# EAGLE design mem3-b (EAGLE 9.7.0)
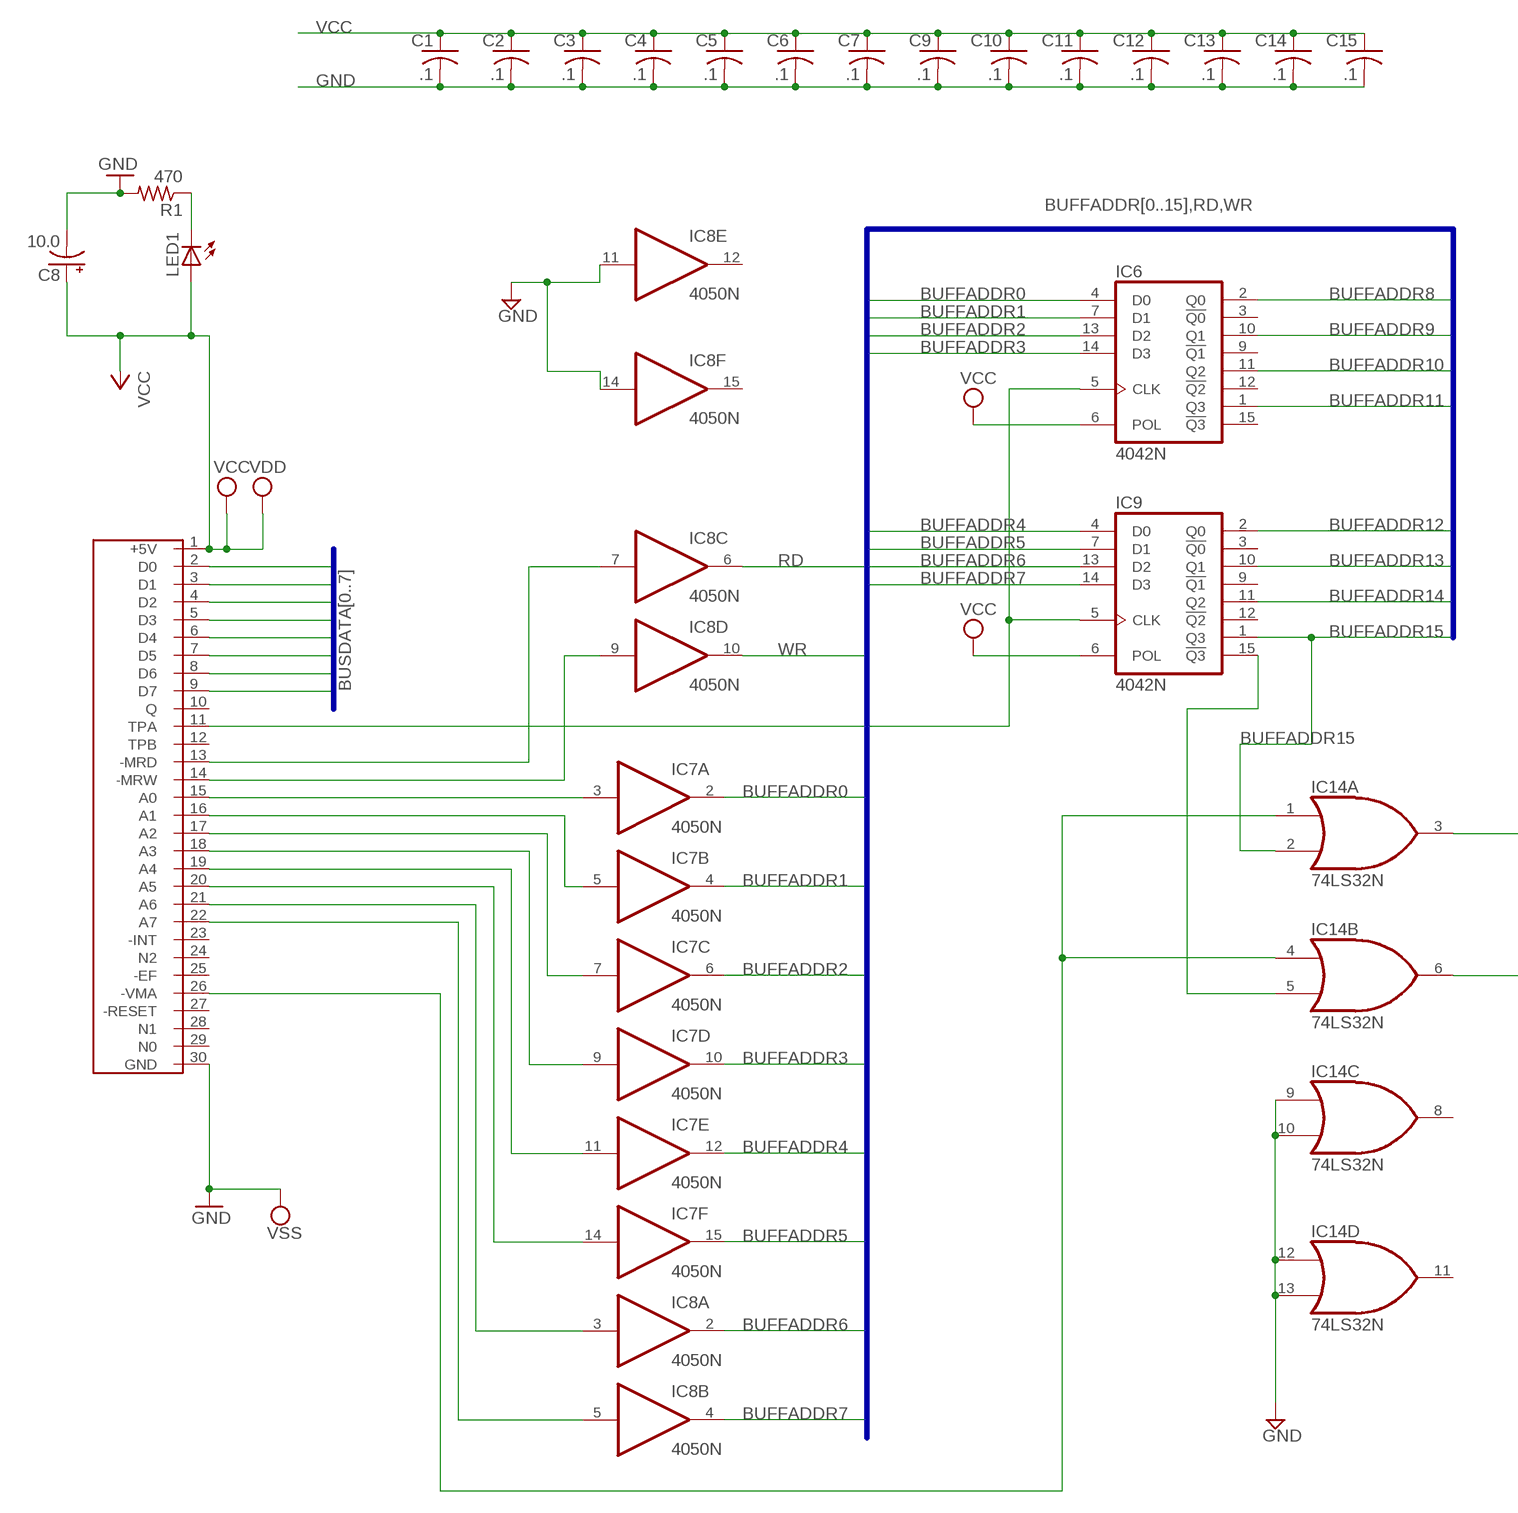
[diagram p0: schematic, sheet 1, part 1 of 2]
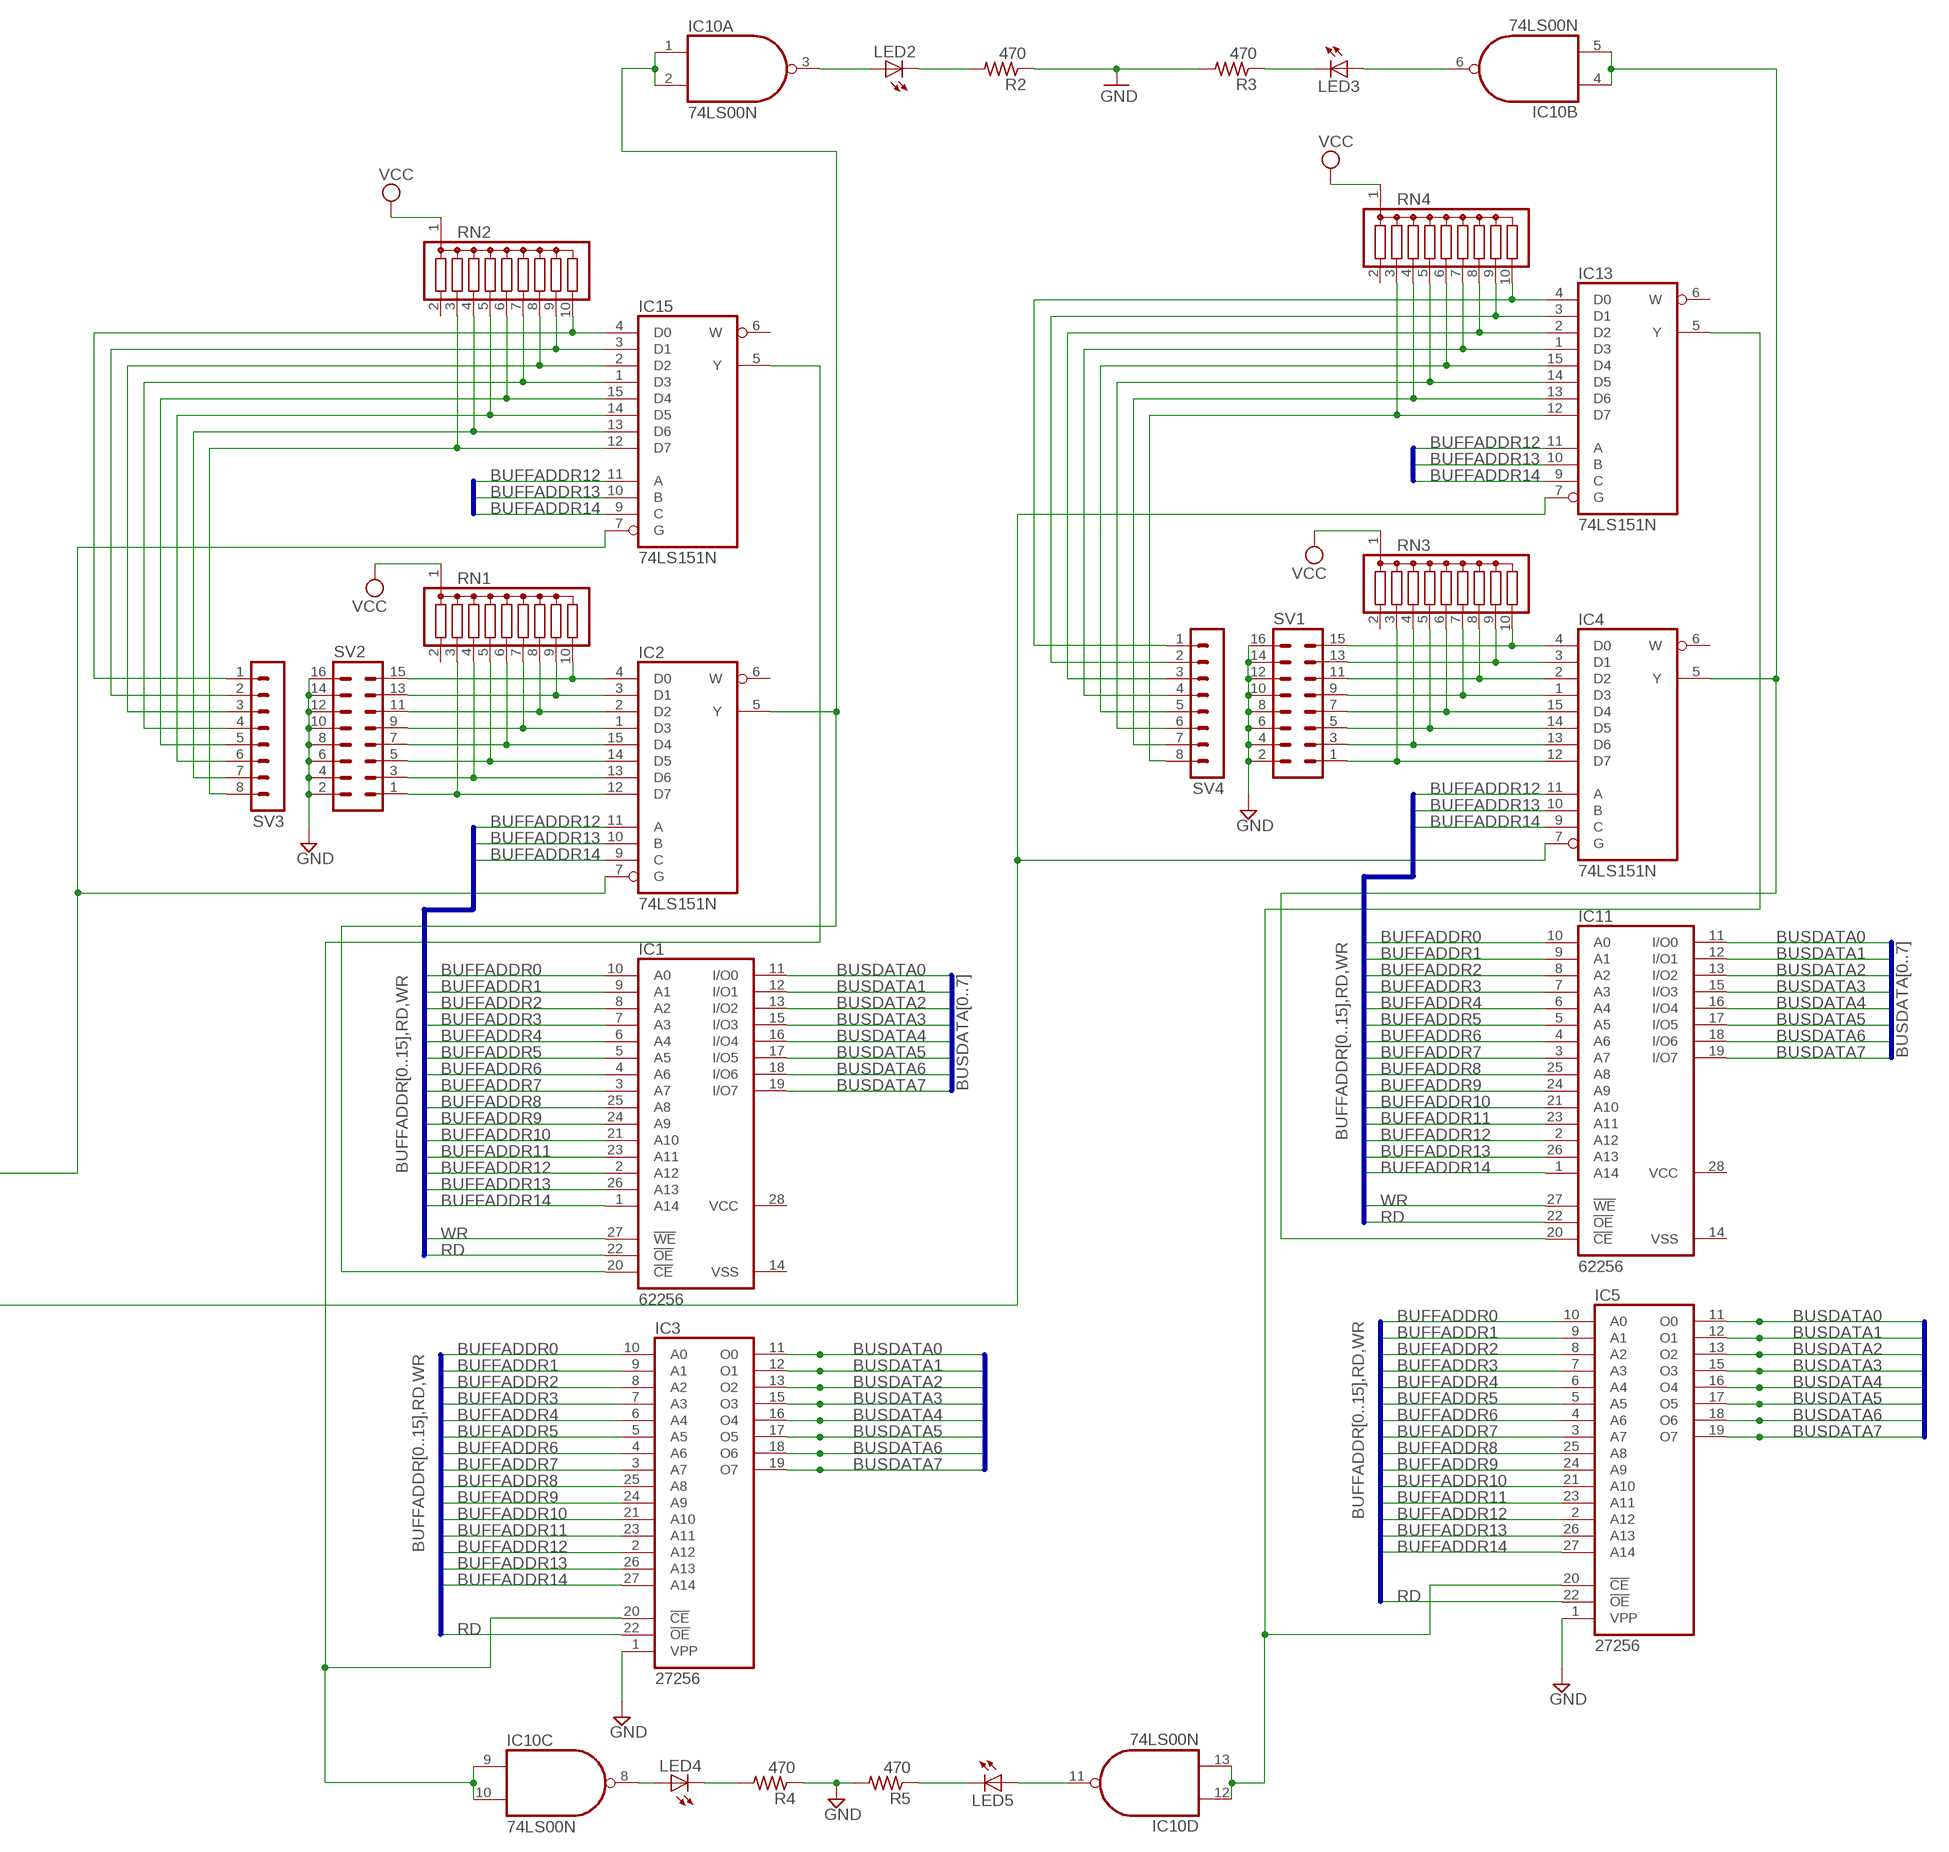
[diagram p1: schematic, sheet 1, part 2 of 2]

## Parts
C1  .1  C-US025-050X050  [C025-050X050]
C2  .1  C-US025-050X050  [C025-050X050]
C3  .1  C-US025-050X050  [C025-050X050]
C4  .1  C-US025-050X050  [C025-050X050]
C5  .1  C-US025-050X050  [C025-050X050]
C6  .1  C-US025-050X050  [C025-050X050]
C7  .1  C-US025-050X050  [C025-050X050]
C8  10.0  CPOL-USE2.5-7  [E2,5-7]
C9  .1  C-US025-050X050  [C025-050X050]
C10  .1  C-US025-050X050  [C025-050X050]
C11  .1  C-US025-050X050  [C025-050X050]
C12  .1  C-US025-050X050  [C025-050X050]
C13  .1  C-US025-050X050  [C025-050X050]
C14  .1  C-US025-050X050  [C025-050X050]
C15  .1  C-US025-050X050  [C025-050X050]
IC1  62256  58C256P  [DIL28-6]
IC2  74LS151N  [DIL16]
IC3  27256  [DIL28]
IC4  74LS151N  [DIL16]
IC5  27256  [DIL28]
IC6  4042N  [DIL16]
IC7  4050N  [DIL16]
IC8  4050N  [DIL16]
IC9  4042N  [DIL16]
IC10  74LS00N  [DIL14]
IC11  62256  58C256P  [DIL28-6]
IC13  74LS151N  [DIL16]
IC14  74LS32N  [DIL14]
IC15  74LS151N  [DIL16]
LED1  LED5MM  [LED5MM]
LED2  LED5MM  [LED5MM]
LED3  LED5MM  [LED5MM]
LED4  LED5MM  [LED5MM]
LED5  LED5MM  [LED5MM]
R1  470  R-US_0207/7  [0207/7]
R2  470  R-US_0207/7  [0207/7]
R3  470  R-US_0207/7  [0207/7]
R4  470  R-US_0207/7  [0207/7]
R5  470  R-US_0207/7  [0207/7]
RN1  G09R  [SIL10]
RN2  G09R  [SIL10]
RN3  G09R  [SIL10]
RN4  G09R  [SIL10]
SV1  MA08-2  [MA08-2]
SV2  MA08-2  [MA08-2]
SV3  MA08-1  [MA08-1]
SV4  MA08-1  [MA08-1]
U$1  C30  [C30]

## Nets
BUFFADDR0: IC1.10(A0) IC3.10(A0) IC5.10(A0) IC6.4(D0) IC7.2(A:O) IC11.10(A0)
BUFFADDR1: IC1.9(A1) IC3.9(A1) IC5.9(A1) IC6.7(D1) IC7.4(B:O) IC11.9(A1)
BUFFADDR2: IC1.8(A2) IC3.8(A2) IC5.8(A2) IC6.13(D2) IC7.6(C:O) IC11.8(A2)
BUFFADDR3: IC1.7(A3) IC3.7(A3) IC5.7(A3) IC6.14(D3) IC7.10(D:O) IC11.7(A3)
BUFFADDR4: IC1.6(A4) IC3.6(A4) IC5.6(A4) IC7.12(E:O) IC9.4(D0) IC11.6(A4)
BUFFADDR5: IC1.5(A5) IC3.5(A5) IC5.5(A5) IC7.15(F:O) IC9.7(D1) IC11.5(A5)
BUFFADDR6: IC1.4(A6) IC3.4(A6) IC5.4(A6) IC8.2(A:O) IC9.13(D2) IC11.4(A6)
BUFFADDR7: IC1.3(A7) IC3.3(A7) IC5.3(A7) IC8.4(B:O) IC9.14(D3) IC11.3(A7)
BUFFADDR8: IC1.25(A8) IC3.25(A8) IC5.25(A8) IC6.2(Q0) IC11.25(A8)
BUFFADDR9: IC1.24(A9) IC3.24(A9) IC5.24(A9) IC6.10(Q1) IC11.24(A9)
BUFFADDR10: IC1.21(A10) IC3.21(A10) IC5.21(A10) IC6.11(Q2) IC11.21(A10)
BUFFADDR11: IC1.23(A11) IC3.23(A11) IC5.23(A11) IC6.1(Q3) IC11.23(A11)
BUFFADDR12: IC1.2(A12) IC2.11(A) IC3.2(A12) IC4.11(A) IC5.2(A12) IC9.2(Q0) IC11.2(A12) IC13.11(A) IC15.11(A)
BUFFADDR13: IC1.26(A13) IC2.10(B) IC3.26(A13) IC4.10(B) IC5.26(A13) IC9.10(Q1) IC11.26(A13) IC13.10(B) IC15.10(B)
BUFFADDR14: IC1.1(A14) IC2.9(C) IC3.27(A14) IC4.9(C) IC5.27(A14) IC9.11(Q2) IC11.1(A14) IC13.9(C) IC15.9(C)
BUFFADDR15: IC9.1(Q3) IC14.2(A:I1)
BUSDATA0: IC1.11(I/O0) IC3.11(O0) IC5.11(O0) IC11.11(I/O0) U$1.2(D0)
BUSDATA1: IC1.12(I/O1) IC3.12(O1) IC5.12(O1) IC11.12(I/O1) U$1.3(D1)
BUSDATA2: IC1.13(I/O2) IC3.13(O2) IC5.13(O2) IC11.13(I/O2) U$1.4(D2)
BUSDATA3: IC1.15(I/O3) IC3.15(O3) IC5.15(O3) IC11.15(I/O3) U$1.5(D3)
BUSDATA4: IC1.16(I/O4) IC3.16(O4) IC5.16(O4) IC11.16(I/O4) U$1.6(D4)
BUSDATA5: IC1.17(I/O5) IC3.17(O5) IC5.17(O5) IC11.17(I/O5) U$1.7(D5)
BUSDATA6: IC1.18(I/O6) IC3.18(O6) IC5.18(O6) IC11.18(I/O6) U$1.8(D6)
BUSDATA7: IC1.19(I/O7) IC3.19(O7) IC5.19(O7) IC11.19(I/O7) U$1.9(D7)
GND: C1.2 C2.2 C3.2 C4.2 C5.2 C6.2 C7.2 C8.- C9.2 C10.2 C11.2 C12.2 C13.2 C14.2 C15.2 IC3.1(VPP) IC5.1(VPP) IC8.11(E:I) IC8.14(F:I) IC14.9(C:I0) IC14.10(C:I1) IC14.12(D:I0) IC14.13(D:I1) R1.2 R2.1 R3.2 R4.1 R5.2 SV1.2 SV1.4 SV1.6 SV1.8 SV1.10 SV1.12 SV1.14 SV1.16 SV2.2 SV2.4 SV2.6 SV2.8 SV2.10 SV2.12 SV2.14 SV2.16 U$1.30(GND) ; supply symbol labelled VSS
N$1: LED1.K(C) R1.1
N$2: IC2.12(D7) RN1.3 SV2.1
N$3: IC2.13(D6) RN1.4 SV2.3
N$4: IC2.14(D5) RN1.5 SV2.5
N$5: IC6.5(CLK) IC9.5(CLK) U$1.11(TPA)
N$6: IC2.15(D4) RN1.6 SV2.7
N$7: IC7.3(A:I) U$1.15(A0)
N$8: IC7.5(B:I) U$1.16(A1)
N$9: IC7.7(C:I) U$1.17(A2)
N$10: IC7.9(D:I) U$1.18(A3)
N$11: IC7.11(E:I) U$1.19(A4)
N$12: IC7.14(F:I) U$1.20(A5)
N$13: IC8.3(A:I) U$1.21(A6)
N$14: IC8.5(B:I) U$1.22(A7)
N$15: IC2.1(D3) RN1.7 SV2.9
N$16: IC2.2(D2) RN1.8 SV2.11
N$17: IC2.3(D1) RN1.9 SV2.13
N$18: IC2.4(D0) RN1.10 SV2.15
N$19: IC10.8(C:O) LED4.A
N$20: IC4.7(G) IC13.7(G) IC14.6(B:O)
N$21: IC4.12(D7) RN3.3 SV1.1
N$22: IC4.13(D6) RN3.4 SV1.3
N$23: IC4.14(D5) RN3.5 SV1.5
N$24: IC4.15(D4) RN3.6 SV1.7
N$25: IC8.9(D:I) U$1.14(-MRW)
N$26: IC8.7(C:I) U$1.13(-MRD)
N$27: IC14.1(A:I0) IC14.4(B:I0) U$1.26(-VMA)
N$28: IC4.1(D3) RN3.7 SV1.9
N$29: IC4.2(D2) RN3.8 SV1.11
N$30: IC4.3(D1) RN3.9 SV1.13
N$32: LED4.K(C) R4.2
N$33: IC4.4(D0) RN3.10 SV1.15
N$34: IC1.20(!CE) IC2.5(Y) IC10.1(A:I0) IC10.2(A:I1)
N$36: IC3.20(!CE) IC10.9(C:I0) IC10.10(C:I1) IC15.5(Y)
N$38: IC13.13(D6) RN4.4 SV4.7
N$39: IC13.14(D5) RN4.5 SV4.6
N$40: IC13.15(D4) RN4.6 SV4.5
N$41: IC13.1(D3) RN4.7 SV4.4
N$42: IC13.2(D2) RN4.8 SV4.3
N$43: IC13.3(D1) RN4.9 SV4.2
N$45: IC13.12(D7) RN4.3 SV4.8
N$46: IC13.4(D0) RN4.10 SV4.1
N$49: IC5.20(!CE) IC10.12(D:I0) IC10.13(D:I1) IC13.5(Y)
N$50: IC9.15(!Q3) IC14.5(B:I1)
N$51: IC4.5(Y) IC10.4(B:I0) IC10.5(B:I1) IC11.20(!CE)
N$52: IC2.7(G) IC14.3(A:O) IC15.7(G)
N$55: IC15.12(D7) RN2.3 SV3.8
N$56: LED5.K(C) R5.1
N$57: IC10.11(D:O) LED5.A
N$58: IC10.3(A:O) LED2.A
N$59: LED2.K(C) R2.2
N$60: IC15.13(D6) RN2.4 SV3.7
N$61: LED3.K(C) R3.1
N$62: IC10.6(B:O) LED3.A
N$63: IC15.14(D5) RN2.5 SV3.6
N$64: IC15.15(D4) RN2.6 SV3.5
N$65: IC15.1(D3) RN2.7 SV3.4
N$66: IC15.2(D2) RN2.8 SV3.3
N$67: IC15.3(D1) RN2.9 SV3.2
N$68: IC15.4(D0) RN2.10 SV3.1
RD: IC1.22(!OE) IC3.22(!OE) IC5.22(!OE) IC8.6(C:O) IC11.22(!OE)
VCC: C1.1 C2.1 C3.1 C4.1 C5.1 C6.1 C7.1 C8.+ C9.1 C10.1 C11.1 C12.1 C13.1 C14.1 C15.1 IC6.6(POL) IC9.6(POL) LED1.A RN1.1 RN2.1 RN3.1 RN4.1 U$1.1(+5V) ; supply symbol labelled VDD
WR: IC1.27(!WE) IC8.10(D:O) IC11.27(!WE)
Unconnected: IC2.6(W) IC4.6(W) IC6.3(!Q0) IC6.9(!Q1) IC6.12(!Q2) IC6.15(!Q3) IC8.12(E:O) IC8.15(F:O) IC9.3(!Q0) IC9.9(!Q1) IC9.12(!Q2) IC13.6(W) IC14.8(C:O) IC14.11(D:O) IC15.6(W) RN1.2 RN2.2 RN3.2 RN4.2 U$1.10(Q) U$1.12(TPB) U$1.23(-INT) U$1.24(N2) U$1.25(-EF) U$1.27(-RESET) U$1.28(N1) U$1.29(N0)

## Buses
BUFFADDR[0..15],RD,WR
BUSDATA[0..7]

## Power pins joined to a net without a drawn wire
GND: IC1.14(VSS) IC2.8(GND) IC3.14(GND) IC4.8(GND) IC5.14(GND) IC6.8(VSS) IC7.8(P:VSS) IC8.8(P:VSS) IC9.8(VSS) IC10.7(P:GND) IC11.14(VSS) IC13.8(GND) IC14.7(P:GND) IC15.8(GND)
VCC: IC1.28(VCC) IC2.16(VCC) IC3.28(VCC) IC4.16(VCC) IC5.28(VCC) IC6.16(VDD) IC7.1(P:VDD) IC8.1(P:VDD) IC9.16(VDD) IC10.14(P:VCC) IC11.28(VCC) IC13.16(VCC) IC14.14(P:VCC) IC15.16(VCC)

## Library data of the parts
C1-C7 C9-C15 = rcl:C-US: CAPACITOR, American symbol
C8 = rcl:CPOL-US: POLARIZED CAPACITOR, American symbol
IC1 IC11 = memory-hitachi:58C256P: MEMORY
IC2 IC4 IC13 IC15 = 74xx-us:74*151: Data SELECTOR/MULTIPLEXER
IC3 IC5 = memory:27256: MEMORY
IC6 IC9 = 40xx:4042: Quad clocked D LATCH
IC7 IC8 = 40xx:4050: Hex non-inverting BUFFER
IC10 = 74xx-us:74*00: Quad 2-input NAND gate
IC14 = 74xx-us:74*32: Quad 2-input OR gate
LED1-LED5 = led:LED: LED OSRAM: - CHIPLED LG R971, LG N971, LY N971, LG Q971, LY Q971, LO R971, LY R971 LH N974, LH R974 LS Q976, LO Q976, LY Q976 LO Q996 - Hyper CHIPLED LW Q18S LB Q993, LB Q99A, LB R99A - SideLED LS A670, LO A670, LY A670, LG A670, LP A670 LB A673, LV A673, LT A673, LW A673 LH A674 LY A675 LS A676, LA A676, LO A676, LY A676, LW A676 LS A679, LY A679, LG A679 - Hyper Micro SIDELED® LS Y876, LA Y876, LO Y876, LY Y876 LT Y87S - SmartLED LW L88C, LW L88S LB L89C, LB L89S, LG L890 LS L89K, LO L89K, LY L89K LS L896, LA L896, LO L896, LY L896 - TOPLED LS T670, LO T670, LY T670, LG T670, LP T670 LSG T670, LSP T670, LSY T670, LOP T670, LYG T670 LG T671, LOG T671, LSG T671 LB T673, LV T673, LT T673, LW T673 LH T674 LS T676, LA T676, LO T676, LY T676, LB T676, LH T676, LSB T676, LW T676 LB T67C, LV T67C, LT T67C, LS T67K, LO T67K, LY T67K, LW E67C LS E67B, LA E67B, LO E67B, LY E67B, LB E67C, LV E67C, LT E67C LW T67C LS T679, LY T679, LG T679 LS T770, LO T770, LY T770, LG T770, LP T770 LB T773, LV T773, LT T773, LW T773 LH T774 LS E675, LA E675, LY E675, LS T675 LS T776, LA T776, LO T776, LY T776, LB T776 LHGB T686 LT T68C, LB T68C - Hyper Mini TOPLED® LB M676 - Mini TOPLED Santana® LG M470 LS M47K, LO M47K, LY M47K Source: http://www.osram.convergy.de/
R1-R5 = rcl:R-US_: RESISTOR, American symbol
RN1-RN4 = resistor-sil:G09R: SIL RESISTOR
SV1 SV2 = con-lstb:MA08-2: PIN HEADER
SV3 SV4 = con-lstb:MA08-1: PIN HEADER
U$1 = k1:C30

## Board
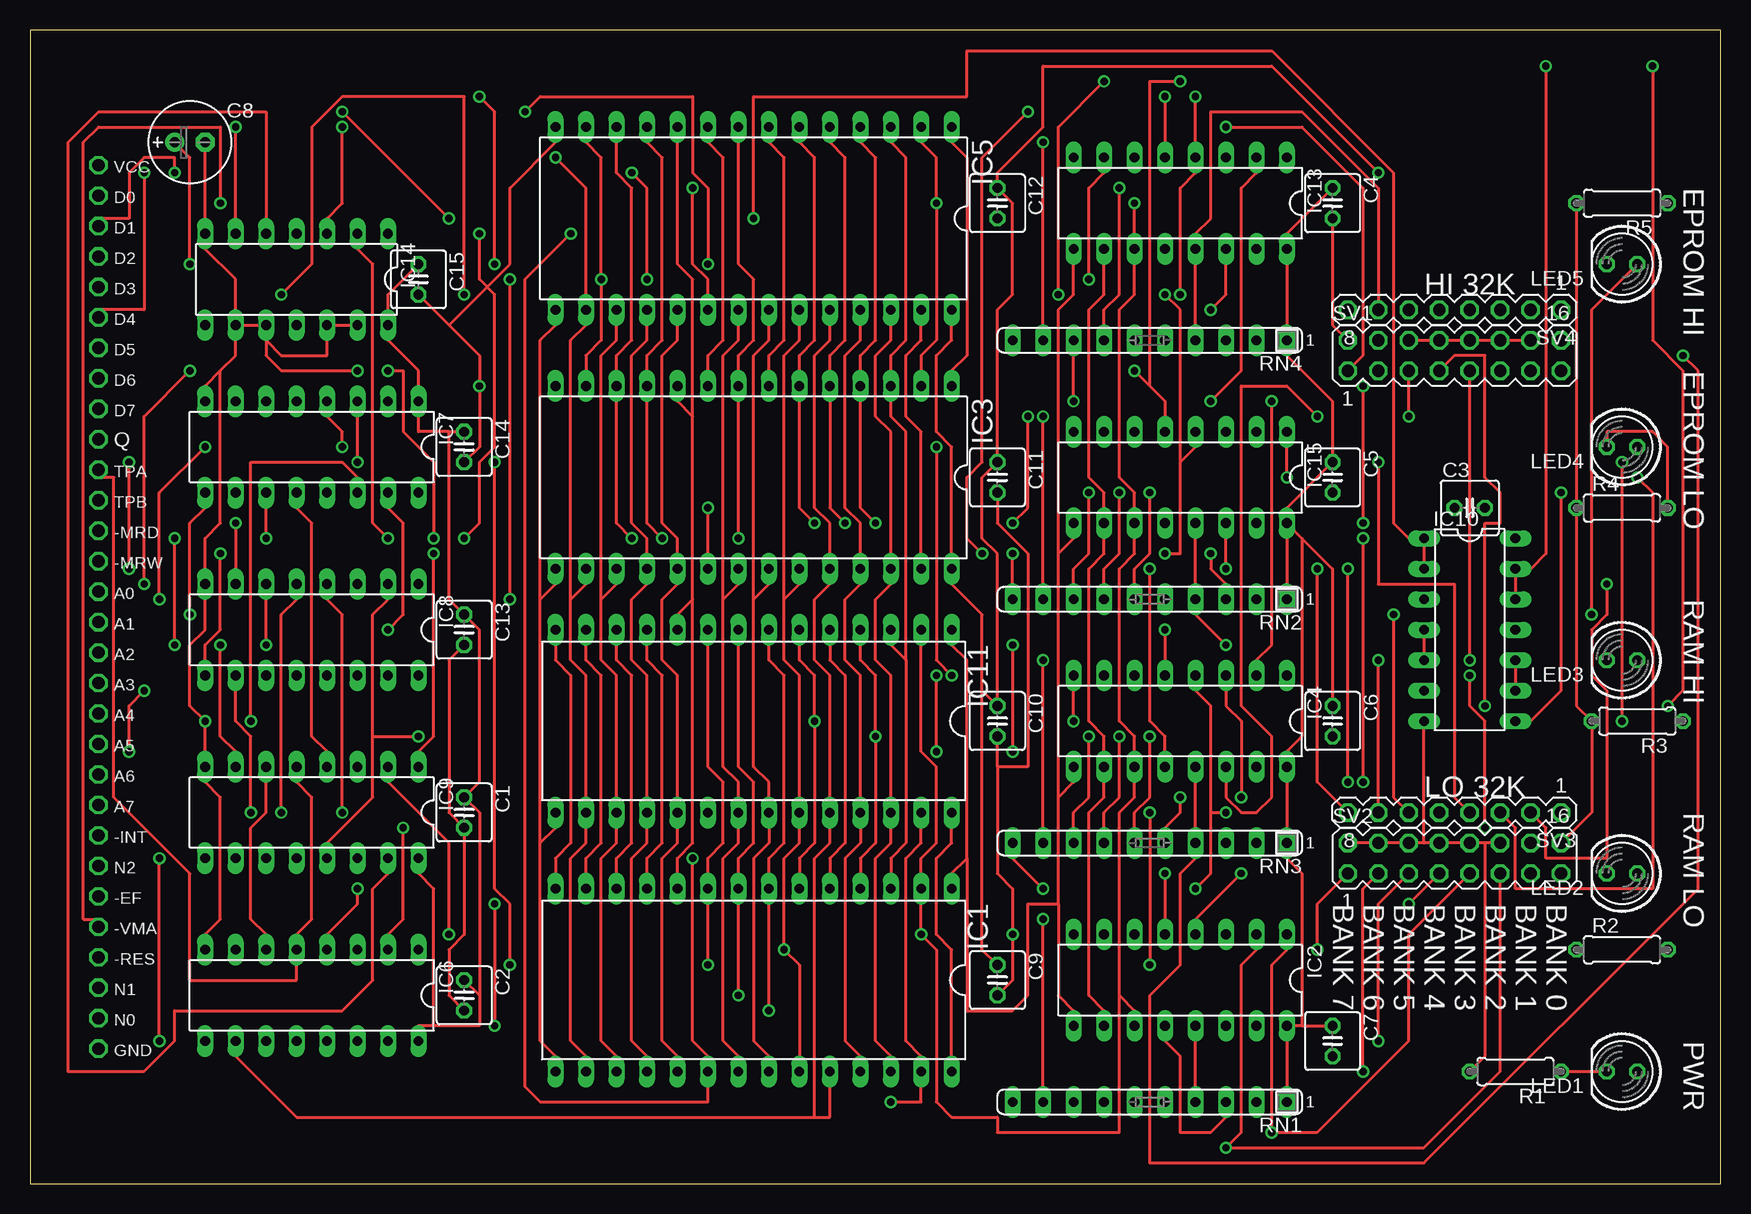
[diagram p2: board, top side]
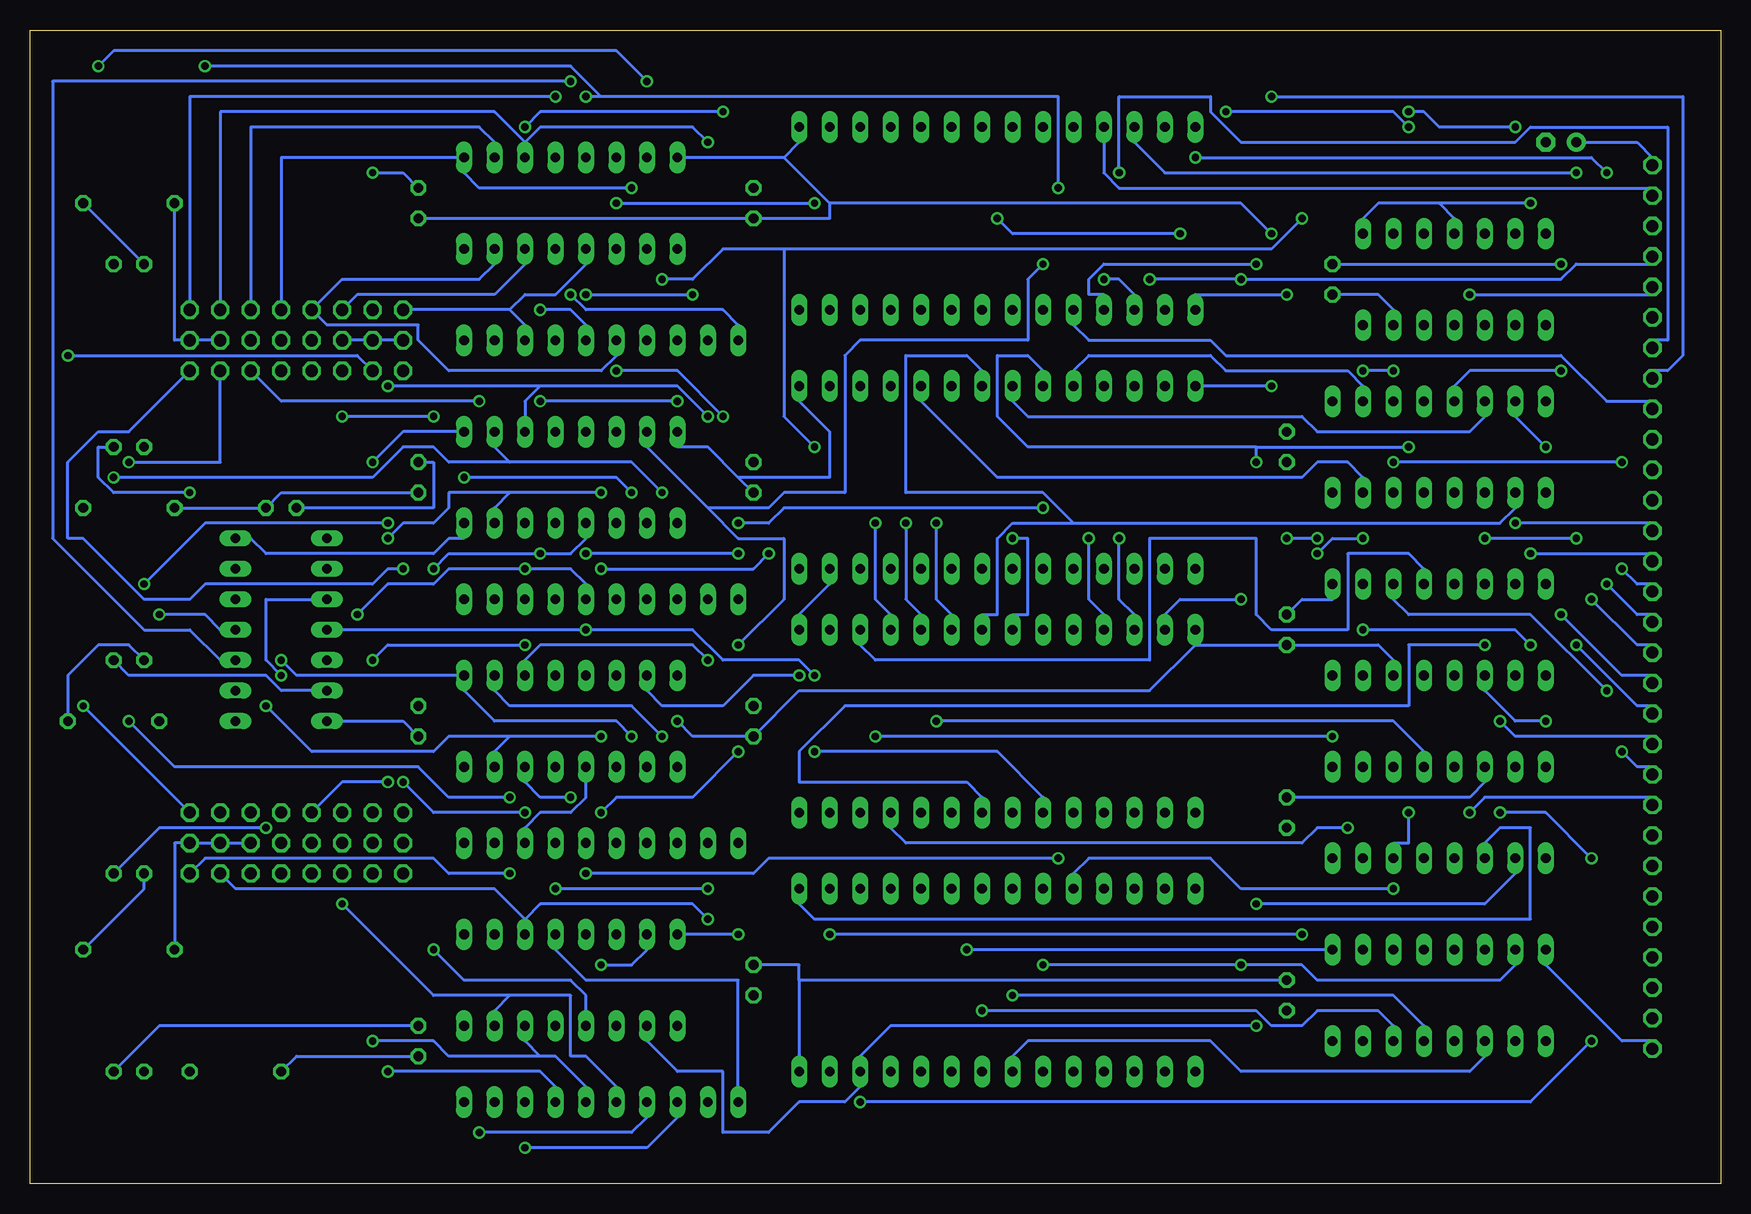
[diagram p3: board, bottom side, seen from below]

Size 140.95 x 96.19 mm. Coordinates in mm from the lower left corner, seen from the top.
Outline: 0,0 140.95,0 140.95,96.19 0,96.19 0,0
Copper layers (1*16): Top 0.035mm / dielectric 1.5mm / Bottom 0.035mm
Design rules "Fusion Electronics Design Rules": minimum track width 10mil, minimum drill 24mil, track to track 8mil, track to pad 8mil, pad to pad 8mil, via to via 8mil, smd to smd 8mil, copper to edge 40mil, drill to drill 8mil, minimum pad ring 10mil, minimum via ring 8mil, stop-mask expansion 4mil, vias tented up to drill 0mil, thermal gap 10mil
tRestrict: area 0.6,91.9 to 76.8,95.7; area 0.6,0.5 to 76.8,4.3

### Footprints (pad centres in the part's own frame; a part is rotated, then mirrored left to right if it is on the bottom)
C025-050X050 = drill 0.813 octagon: 1 -1.27,0; 2 1.27,0
E2,5-7 = drill 0.813 pad 1.6: + -1.27,0 | drill 0.813 pad 1.6 octagon: - 1.27,0
DIL28-6 = drill 0.813 long: 1 -16.51,-7.62; 2 -13.97,-7.62; 3 -11.43,-7.62; 4 -8.89,-7.62; 5 -6.35,-7.62; 6 -3.81,-7.62; 7 -1.27,-7.62; 8 1.27,-7.62; 9 3.81,-7.62; 10 6.35,-7.62; 11 8.89,-7.62; 12 11.43,-7.62; 13 13.97,-7.62; 14 16.51,-7.62; 15 16.51,7.62; 16 13.97,7.62; 17 11.43,7.62; 18 8.89,7.62; 19 6.35,7.62; 20 3.81,7.62; 21 1.27,7.62; 22 -1.27,7.62; 23 -3.81,7.62; 24 -6.35,7.62; 25 -8.89,7.62; 26 -11.43,7.62; 27 -13.97,7.62; 28 -16.51,7.62
DIL16 = drill 0.813 long: 1 -8.89,-3.81; 2 -6.35,-3.81; 3 -3.81,-3.81; 4 -1.27,-3.81; 5 1.27,-3.81; 6 3.81,-3.81; 7 6.35,-3.81; 8 8.89,-3.81; 9 8.89,3.81; 10 6.35,3.81; 11 3.81,3.81; 12 1.27,3.81; 13 -1.27,3.81; 14 -3.81,3.81; 15 -6.35,3.81; 16 -8.89,3.81
DIL28 = drill 0.813 long: 1 -16.51,-7.62; 2 -13.97,-7.62; 3 -11.43,-7.62; 4 -8.89,-7.62; 5 -6.35,-7.62; 6 -3.81,-7.62; 7 -1.27,-7.62; 8 1.27,-7.62; 9 3.81,-7.62; 10 6.35,-7.62; 11 8.89,-7.62; 12 11.43,-7.62; 13 13.97,-7.62; 14 16.51,-7.62; 15 16.51,7.62; 16 13.97,7.62; 17 11.43,7.62; 18 8.89,7.62; 19 6.35,7.62; 20 3.81,7.62; 21 1.27,7.62; 22 -1.27,7.62; 23 -3.81,7.62; 24 -6.35,7.62; 25 -8.89,7.62; 26 -11.43,7.62; 27 -13.97,7.62; 28 -16.51,7.62
DIL14 = drill 0.813 long: 1 -7.62,-3.81; 2 -5.08,-3.81; 3 -2.54,-3.81; 4 0,-3.81; 5 2.54,-3.81; 6 5.08,-3.81; 7 7.62,-3.81; 8 7.62,3.81; 9 5.08,3.81; 10 2.54,3.81; 11 0,3.81; 12 -2.54,3.81; 13 -5.08,3.81; 14 -7.62,3.81
LED5MM = drill 0.813 octagon: A -1.27,0; K 1.27,0
0207/7 = drill 0.813 octagon: 1 -3.81,0; 2 3.81,0
SIL10 = drill 0.813 long: 1 -11.43,0; 2 -8.89,0; 3 -6.35,0; 4 -3.81,0; 5 -1.27,0; 6 1.27,0; 7 3.81,0; 8 6.35,0; 9 8.89,0; 10 11.43,0
MA08-2 = drill 1.016 octagon: 1 -8.89,-1.27; 2 -8.89,1.27; 3 -6.35,-1.27; 4 -6.35,1.27; 5 -3.81,-1.27; 6 -3.81,1.27; 7 -1.27,-1.27; 8 -1.27,1.27; 9 1.27,-1.27; 10 1.27,1.27; 11 3.81,-1.27; 12 3.81,1.27; 13 6.35,-1.27; 14 6.35,1.27; 15 8.89,-1.27; 16 8.89,1.27
MA08-1 = drill 1.016 octagon: 1 -8.89,0; 2 -6.35,0; 3 -3.81,0; 4 -1.27,0; 5 1.27,0; 6 3.81,0; 7 6.35,0; 8 8.89,0
C30 = drill 1.016 octagon: 1 -36.83,0; 2 -34.29,0; 3 -31.75,0; 4 -29.21,0; 5 -26.67,0; 6 -24.13,0; 7 -21.59,0; 8 -19.05,0; 9 -16.51,0; 10 -13.97,0; 11 -11.43,0; 12 -8.89,0; 13 -6.35,0; 14 -3.81,0; 15 -1.27,0; 16 1.27,0; 17 3.81,0; 18 6.35,0; 19 8.89,0; 20 11.43,0; 21 13.97,0; 22 16.51,0; 23 19.05,0; 24 21.59,0; 25 24.13,0; 26 26.67,0; 27 29.21,0; 28 31.75,0; 29 34.29,0; 30 36.83,0

### Placement (x,y rotation side)
C1  36.19,30.95 270 top
C2  36.19,15.71 270 top
C3  120.01,56.35 0 top
C4  108.58,81.75 270 top
C5  108.58,58.89 270 top
C6  108.58,38.57 270 top
C7  108.58,11.9 270 top
C8  13.33,86.83 0 top
C9  80.64,16.98 270 top
C10  80.64,38.57 270 top
C11  80.64,58.89 270 top
C12  80.64,81.75 270 top
C13  36.19,46.19 270 top
C14  36.19,61.43 270 top
C15  32.38,75.4 270 top
IC1  60.32,16.98 180 top
IC2  95.88,16.98 180 top
IC3  60.32,58.89 180 top
IC4  95.88,38.57 180 top
IC5  60.32,80.48 180 top
IC6  23.49,15.71 180 top
IC7  23.49,61.43 180 top
IC8  23.49,46.19 180 top
IC9  23.49,30.95 180 top
IC10  120.01,46.19 270 top
IC11  60.32,38.57 180 top
IC13  95.88,81.75 180 top
IC14  22.22,75.4 180 top
IC15  95.88,58.89 180 top
LED1  132.71,9.36 180 top
LED2  132.71,25.87 180 top
LED3  132.71,43.65 180 top
LED4  132.71,61.43 180 top
LED5  132.71,76.67 180 top
R1  123.82,9.36 180 top
R2  132.71,19.52 0 top
R3  133.98,38.57 180 top
R4  132.71,56.35 0 top
R5  132.71,81.75 180 top
RN1  93.34,6.82 180 top
RN2  93.34,48.73 180 top
RN3  93.34,28.41 180 top
RN4  93.34,70.32 180 top
SV1  118.74,69.05 0 top
SV2  118.74,27.14 0 top
SV3  118.74,30.95 180 top
SV4  118.74,72.86 180 top
U$1  5.71,48.09 270 top

### Tracks (layer width: path | path; a pad name or v marks a point on that pad's centre or on a via)
BUFFADDR0  (via drill 0.61)
  Top 0.254: v27.3,24.6 27.3,23.33 24.76,20.79 IC6.4 | 55.24,48.73 53.97,47.46 IC11.10 | 55.24,48.73 55.24,63.97 | 55.24,63.97 53.97,65.24 IC3.10 | 55.24,63.97 55.24,75.4 53.97,76.67 IC5.10 | 55.24,48.73 55.24,28.41 53.97,27.14 IC1.10
  Bottom 0.254: v27.3,24.6 40,24.6 42.54,27.14 52.7,27.14 53.97,25.87 IC1.10 | IC7.2 29.84,66.51 31.11,67.78 41.27,67.78 42.54,69.05 52.7,69.05 53.97,67.78 IC3.10
BUFFADDR1  (via drill 0.61)
  Top 0.254: v26.03,61.43 26.03,62.7 24.76,63.97 IC7.4 | IC5.9 56.51,86.83 57.78,85.56 57.78,70.32 56.51,69.05 IC3.9 | v56.51,18.25 IC1.9 56.51,27.14 57.78,28.41 57.78,33.49 56.51,34.76 IC11.9 | v38.73,60.16 38.73,24.6 40,23.33 v40,18.25
  Bottom 0.254: 38.73,61.43 57.78,61.43 60.32,63.97 60.32,69.05 57.78,69.05 56.51,67.78 IC3.9 | 38.73,61.43 v26.03,61.43 | v56.51,18.25 v40,18.25 34.92,18.25 33.65,16.98 18.41,16.98 17.14,18.25 IC6.7 | v38.73,60.16 38.73,61.43
BUFFADDR2  (via drill 0.61)
  Top 0.254: IC5.8 59.05,76.67 60.32,75.4 60.32,70.32 59.05,69.05 IC3.8 v59.05,53.81 | v59.05,15.71 IC1.8 59.05,27.14 60.32,28.41 60.32,33.49 59.05,34.76 IC11.8
  Bottom 0.254: IC7.6 19.68,63.97 20.95,62.7 33.65,62.7 34.92,63.97 57.78,63.97 59.05,65.24 IC3.8 | v59.05,15.71 27.3,15.71 24.76,13.17 IC6.13 | v59.05,53.81 57.78,53.81 57.78,47.46 59.05,47.46 IC11.8
BUFFADDR3  (via drill 0.61)
  Top 0.254: v61.59,14.44 IC1.7 61.59,27.14 62.86,28.41 62.86,42.38 61.59,43.65 IC11.7 | IC3.7 61.59,69.05 62.86,70.32 62.86,85.56 61.59,86.83 IC5.7
  Bottom 0.254: v61.59,14.44 38.73,14.44 37.46,13.17 34.92,13.17 33.65,14.44 28.57,14.44 27.3,13.17 IC6.14 | 53.97,55.08 59.05,55.08 60.32,53.81 60.32,47.46 61.59,47.46 IC11.7 | 53.97,55.08 18.41,55.08 17.14,56.35 IC7.10 | 53.97,55.08 56.51,57.62 67.94,57.62 67.94,69.05 62.86,69.05 61.59,67.78 IC3.7
BUFFADDR4  (via drill 0.61)
  Top 0.254: IC7.12 22.22,56.35 23.49,55.08 23.49,37.3 24.76,36.03 IC9.4 | IC1.6 64.13,27.14 65.4,28.41 v65.4,38.57 65.4,42.38 64.13,43.65 IC11.6 | IC5.6 64.13,86.83 65.4,85.56 65.4,70.32 64.13,69.05 IC3.6 64.13,56.35 v65.4,55.08
  Bottom 0.254: v65.4,55.08 65.4,48.73 64.13,47.46 IC11.6 | v65.4,38.57 27.3,38.57 24.76,36.03 IC9.4
BUFFADDR5  (via drill 0.61)
  Top 0.254: v15.87,44.92 15.87,37.3 17.14,36.03 IC9.7 | v29.84,46.19 31.11,47.46 31.11,55.08 29.84,56.35 IC7.15 | IC1.5 66.67,27.14 67.94,28.41 67.94,42.38 66.67,43.65 IC11.5 | IC5.5 66.67,86.83 67.94,85.56 67.94,70.32 66.67,69.05 IC3.5 66.67,56.35 v67.94,55.08
  Bottom 0.254: v15.87,44.92 17.14,46.19 v29.84,46.19 | v67.94,55.08 67.94,48.73 66.67,47.46 IC11.5 | IC7.15 29.84,58.89 31.11,60.16 33.65,60.16 34.92,58.89 60.32,58.89 66.67,65.24 IC3.5
BUFFADDR6  (via drill 0.61)
  Top 0.254: 28.57,37.3 28.57,47.46 29.84,48.73 IC8.2 | 28.57,37.3 28.57,32.22 24.76,28.41 IC9.13 | IC1.4 69.21,27.14 70.48,28.41 v70.48,37.3 70.48,42.38 69.21,43.65 IC11.4 | IC5.4 69.21,86.83 70.48,85.56 70.48,70.32 69.21,69.05 IC3.4 69.21,56.35 v70.48,55.08 | 28.57,37.3 v32.38,37.3
  Bottom 0.254: v70.48,55.08 70.48,48.73 69.21,47.46 IC11.4 | v32.38,37.3 v70.48,37.3
BUFFADDR7  (via drill 0.61)
  Top 0.254: v26.03,30.95 26.03,47.46 24.76,48.73 IC8.4 | 73.02,43.65 73.02,28.41 71.75,27.14 IC1.3 | 73.02,43.65 71.75,44.92 IC11.3 | 73.02,43.65 73.02,62.7 71.75,63.97 IC3.3 71.75,69.05 73.02,70.32 73.02,85.56 71.75,86.83 IC5.3
  Bottom 0.254: v26.03,30.95 26.03,28.41 27.3,28.41 IC9.14 | IC8.4 24.76,51.27 26.03,52.54 31.11,52.54 31.11,46.19 37.46,46.19 38.73,47.46 38.73,53.81 47.62,53.81 47.62,43.65 70.48,43.65 71.75,44.92 IC11.3
BUFFADDR8  (via drill 0.61)
  Top 0.254: v31.11,29.68 31.11,22.06 29.84,20.79 IC6.2 | IC1.25 69.21,10.63 67.94,11.9 67.94,27.14 69.21,28.41 IC11.25 69.21,42.38 67.94,43.65 67.94,48.73 69.21,50 IC3.25 69.21,55.08 67.94,56.35 67.94,69.05 69.21,70.32 IC5.25
  Bottom 0.254: v31.11,29.68 33.65,29.68 34.92,28.41 67.94,28.41 69.21,29.68 IC11.25
BUFFADDR9
  Top 0.254: 65.4,5.55 66.67,5.55 IC1.24 | 65.4,5.55 22.22,5.55 17.14,10.63 IC6.10 | 65.4,5.55 65.4,27.14 66.67,28.41 IC11.24 66.67,42.38 65.4,43.65 65.4,48.73 66.67,50 IC3.24 66.67,55.08 65.4,56.35 65.4,69.05 66.67,70.32 IC5.24
BUFFADDR10
  Top 0.254: IC1.21 59.05,10.63 57.78,11.9 57.78,27.14 59.05,28.41 IC11.21 59.05,33.49 57.78,34.76 57.78,48.73 | 57.78,48.73 59.05,50 IC3.21 | 57.78,48.73 57.78,69.05 59.05,70.32 IC5.21
  Bottom 0.254: IC6.11 19.68,10.63 20.95,9.36 40,9.36 42.54,11.9 57.78,11.9 59.05,10.63 IC1.21
BUFFADDR11  (via drill 0.61)
  Top 0.254: IC1.23 64.13,18.25 v62.86,19.52 62.86,27.14 64.13,28.41 IC11.23 64.13,42.38 62.86,43.65 62.86,48.73 | 62.86,48.73 64.13,50 IC3.23 | 62.86,48.73 62.86,69.05 64.13,70.32 IC5.23
  Bottom 0.254: IC6.1 v62.86,19.52
BUFFADDR12  (via drill 0.61)
  Top 0.254: IC11.2 74.29,36.03 75.56,34.76 75.56,28.41 74.29,27.14 IC1.2 v74.29,20.79 75.56,19.52 75.56,6.82 76.83,5.55 80.64,5.55 80.64,4.28 90.8,4.28 90.8,15.71 | v34.92,20.79 34.92,28.41 29.84,33.49 IC9.2 | IC3.2 74.29,69.05 75.56,70.32 v75.56,81.75 75.56,85.56 74.29,86.83 IC5.2 | 90.8,15.71 92.07,14.44 IC2.11 | 90.8,15.71 90.8,30.95 92.07,32.22 IC4.11 92.07,37.3 90.8,38.57 90.8,51.27 92.07,52.54 IC15.11 92.07,57.62 90.8,58.89 90.8,72.86 92.07,74.13 IC13.11 v92.07,81.75
  Bottom 0.254: v34.92,20.79 v74.29,20.79 | v92.07,81.75 v75.56,81.75
BUFFADDR13  (via drill 0.61)
  Top 0.254: IC2.10 89.53,14.44 88.26,15.71 88.26,30.95 89.53,32.22 IC4.10 89.53,37.3 88.26,38.57 88.26,51.27 89.53,52.54 IC15.10 89.53,57.62 88.26,58.89 88.26,72.86 89.53,74.13 IC13.10 | IC5.26 71.75,70.32 70.48,69.05 70.48,63.97 71.75,62.7 IC3.26 71.75,50 70.48,48.73 70.48,43.65 71.75,42.38 IC11.26 71.75,28.41 70.48,27.14 70.48,11.9 71.75,10.63 IC1.26 | v38.73,23.33 v38.73,13.17
  Bottom 0.254: v38.73,23.33 19.68,23.33 17.14,25.87 IC9.10 | v38.73,13.17 69.21,13.17 71.75,10.63 IC1.26 71.75,8.09 73.02,6.82 76.83,6.82 79.37,4.28 83.18,4.28 83.18,9.36 86.99,9.36 89.53,11.9 IC2.10
BUFFADDR14
  Top 0.254: 85.72,23.33 85.72,32.22 | 85.72,23.33 85.72,15.71 86.99,14.44 IC2.9 | 85.72,32.22 86.99,33.49 IC4.9 | 85.72,52.54 86.99,53.81 IC15.9 | 85.72,32.22 85.72,52.54 | 85.72,52.54 85.72,72.86 86.99,74.13 IC13.9 | IC5.27 74.29,70.32 73.02,69.05 73.02,63.97 74.29,62.7 IC3.27 | 78.1,27.14 78.1,43.65 76.83,44.92 IC11.1 | 78.1,27.14 76.83,25.87 IC1.1 | 85.72,23.33 83.18,23.33 83.18,15.71 81.91,14.44 78.1,14.44 78.1,27.14
  Bottom 0.254: IC3.27 74.29,50 76.83,47.46 IC11.1 | IC9.11 19.68,28.41 18.41,29.68 15.87,29.68 15.87,22.06 75.56,22.06 76.83,23.33 IC1.1
BUFFADDR15  (via drill 0.61)
  Top 0.254: v33.65,52.54 33.65,37.3 32.38,36.03 IC9.1 | v29.84,53.81 28.57,55.08 28.57,76.67 27.3,77.94 IC14.2
  Bottom 0.254: v33.65,52.54 32.38,53.81 v29.84,53.81
BUSDATA0  (via drill 0.61)
  Top 0.254: IC1.11 51.43,27.14 52.7,28.41 52.7,42.38 51.43,43.65 IC11.11 | IC5.11 51.43,86.83 52.7,85.56 52.7,70.32 51.43,69.05 IC3.11 51.43,55.08 v52.7,53.81
  Bottom 0.254: U$1.2 5.71,83.02 50.16,83.02 51.43,84.29 IC5.11 | v52.7,53.81 52.7,48.73 51.43,47.46 IC11.11
BUSDATA1  (via drill 0.61)
  Top 0.254: IC1.12 48.89,27.14 50.16,28.41 50.16,42.38 48.89,43.65 IC11.12 | IC5.12 48.89,84.29 50.16,83.02 50.16,70.32 48.89,69.05 IC3.12 48.89,55.08 v50.16,53.81 | v12.06,84.29 12.06,85.56 9.52,85.56 8.25,84.29 8.25,80.48 5.71,80.48 U$1.3
  Bottom 0.254: v12.06,84.29 46.35,84.29 48.89,86.83 IC5.12 | v50.16,53.81 50.16,48.73 48.89,47.46 IC11.12
BUSDATA2  (via drill 0.61)
  Top 0.254: IC1.13 46.35,27.14 47.62,28.41 47.62,42.38 46.35,43.65 IC11.13 | IC3.13 46.35,69.05 47.62,70.32 v47.62,75.4 47.62,85.56 46.35,86.83 IC5.13 | v40,48.73 v40,75.4
  Bottom 0.254: v47.62,75.4 v40,75.4 13.33,75.4 12.06,76.67 5.71,76.67 U$1.4 | v40,48.73 45.08,48.73 46.35,47.46 IC11.13
BUSDATA3  (via drill 0.61)
  Top 0.254: 42.54,28.41 42.54,11.9 43.81,10.63 IC1.15 | 42.54,28.41 43.81,29.68 IC11.15 | 42.54,48.73 43.81,50 IC3.15 | 42.54,28.41 42.54,48.73 | 42.54,48.73 42.54,70.32 43.81,71.59 IC5.15 | v20.95,74.13 23.49,76.67 23.49,88.1 26.03,90.64 36.19,90.64 v36.19,74.13
  Bottom 0.254: v20.95,74.13 5.71,74.13 U$1.5 | v36.19,74.13 43.81,74.13 IC5.15
BUSDATA4  (via drill 0.61)
  Top 0.254: IC1.16 46.35,10.63 45.08,11.9 45.08,27.14 46.35,28.41 IC11.16 46.35,42.38 45.08,43.65 45.08,48.73 | 45.08,48.73 46.35,50 IC3.16 | 45.08,48.73 45.08,70.32 46.35,71.59 IC5.16 46.35,83.02 v43.81,85.56 | v9.52,84.29 9.52,72.86 5.71,72.86 U$1.6
  Bottom 0.254: v9.52,84.29 10.79,85.56 v43.81,85.56
BUSDATA5  (via drill 0.61)
  Top 0.254: IC1.17 48.89,10.63 47.62,11.9 47.62,27.14 48.89,28.41 IC11.17 48.89,42.38 47.62,43.65 47.62,48.73 | 47.62,48.73 48.89,50 IC3.17 | 47.62,48.73 47.62,69.05 48.89,70.32 IC5.17 | v50.16,84.29 51.43,83.02 v51.43,75.4
  Bottom 0.254: v50.16,84.29 50.16,90.64 42.54,90.64 42.54,89.37 40,86.83 17.14,86.83 15.87,88.1 4.44,88.1 4.44,70.32 5.71,70.32 U$1.7 | v51.43,75.4 50.16,75.4 48.89,74.13 IC5.17
BUSDATA6  (via drill 0.61)
  Top 0.254: IC1.18 51.43,10.63 50.16,11.9 50.16,27.14 51.43,28.41 IC11.18 51.43,42.38 50.16,43.65 50.16,48.73 51.43,50 IC3.18 51.43,53.81 50.16,55.08 50.16,69.05 51.43,70.32 IC5.18 | v37.46,90.64 38.73,89.37 v38.73,76.67
  Bottom 0.254: v37.46,90.64 3.17,90.64 3.17,69.05 4.44,67.78 5.71,67.78 U$1.8 | v38.73,76.67 51.43,76.67 52.7,75.4 52.7,74.13 51.43,74.13 IC5.18
BUSDATA7
  Top 0.254: IC1.19 53.97,10.63 52.7,11.9 52.7,27.14 53.97,28.41 IC11.19 53.97,42.38 52.7,43.65 52.7,48.73 53.97,50 IC3.19 53.97,53.81 52.7,55.08 52.7,69.05 53.97,70.32 IC5.19
  Bottom 0.254: U$1.9 5.71,65.24 9.52,65.24 13.33,69.05 41.27,69.05 42.54,70.32 52.7,70.32 53.97,71.59 IC5.19
GND  (via drill 0.61)
  Top 0.254: IC6.8 14.6,20.79 15.87,22.06 15.87,32.22 14.6,33.49 IC9.8 v14.6,38.57 13.33,39.84 13.33,44.92 14.6,46.19 IC8.8 14.6,53.81 15.87,55.08 15.87,67.78 | 15.87,67.78 17.14,69.05 IC14.9 | 15.87,67.78 14.6,66.51 IC7.8 | IC14.9 IC14.10 19.68,70.32 | IC14.9 17.14,75.4 14.6,77.94 IC14.7 C8.- | IC14.13 IC14.12 24.76,69.05 20.95,69.05 19.68,70.32 | C14.2 37.46,61.43 v37.46,66.51 37.46,69.05 34.92,71.59 | C15.2 34.92,71.59 | 34.92,71.59 40,76.67 40,83.02 43.81,86.83 IC5.14 | SV2.2 SV2.4 SV2.6 116.2,28.41 | 116.2,28.41 SV2.8 SV2.10 121.28,28.41 | SV2.12 121.28,28.41 | 116.2,28.41 IC10.7 | R1.2 121.28,10.63 121.28,28.41 | C2.2 34.92,15.71 34.92,19.52 36.19,20.79 C1.2 34.92,30.95 34.92,43.65 C13.2 | IC1.14 43.81,27.14 45.08,28.41 45.08,42.38 43.81,43.65 IC11.14 | C9.2 81.91,16.98 v81.91,20.79 81.91,24.6 80.64,25.87 80.64,34.76 | 80.64,34.76 C10.2 | v86.99,38.57 IC4.8 | SV1.6 SV1.8 SV1.10 SV1.12 SV1.14 | IC3.1 76.83,67.78 78.1,69.05 78.1,85.56 76.83,86.83 IC5.1 | SV1.2 108.58,71.59 C4.2 | 80.64,34.76 83.18,34.76 83.18,52.54 80.64,55.08 C11.2 | R5.2 R4.1 128.9,39.84 R3.2 130.17,30.95 SV2.16 | 19.68,70.32 19.68,69.05 20.95,67.78 v27.3,67.78 | v29.84,67.78 31.11,67.78 31.11,62.7 33.65,60.16 v33.65,53.81 | v36.19,53.81 37.46,55.08 37.46,60.16 38.73,61.43 38.73,74.13 37.46,75.4 v37.46,79.21
  Bottom 0.254: IC6.8 14.6,18.25 8.25,11.9 5.71,11.9 U$1.30 | v14.6,38.57 17.14,38.57 19.68,41.11 IC8.11 | v37.46,66.51 IC3.14 | C15.2 28.57,74.13 27.3,72.86 IC14.13 | C7.2 118.74,10.63 R1.2 | R2.1 128.9,28.41 SV2.16 SV2.14 SV2.12 | C6.2 109.85,38.57 IC10.7 | IC8.14 27.3,43.65 28.57,44.92 C13.2 43.81,44.92 | R4.1 C3.2 120.01,57.62 C5.2 | v81.91,20.79 IC2.8 | v86.99,38.57 85.72,37.3 C10.2 76.83,41.11 47.62,41.11 43.81,44.92 | R5.2 128.9,70.32 SV1.16 SV1.14 | SV1.2 SV1.4 SV1.6 | 81.91,58.89 84.45,61.43 86.99,61.43 IC15.8 | 81.91,58.89 C11.2 | 81.91,58.89 74.29,58.89 74.29,62.7 76.83,65.24 IC3.1 | 78.1,85.56 76.83,86.83 IC5.1 | 78.1,85.56 IC13.8 | C4.2 C12.2 74.29,80.48 74.29,81.75 | 74.29,81.75 78.1,85.56 | 43.81,44.92 IC11.14 | v27.3,67.78 v29.84,67.78 | v33.65,53.81 v36.19,53.81 | v37.46,79.21 40,81.75 74.29,81.75
N$1
  Top 0.254: R1.1 LED1.K
N$2  (via drill 0.61)
  Top 0.254: RN1.3 99.69,5.55 98.42,4.28 95.88,4.28 95.88,10.63 94.61,11.9 IC2.12 | SV2.1 107.31,23.33 v107.31,19.52
  Bottom 0.254: v107.31,19.52 104.77,16.98 95.88,16.98 94.61,15.71 IC2.12
N$3  (via drill 0.61)
  Top 0.254: RN1.4 IC2.13 | SV2.3 111.12,24.6 v111.12,9.36
  Bottom 0.254: v111.12,9.36 98.42,9.36 97.15,8.09 RN1.4
N$4  (via drill 0.61)
  Top 0.254: SV2.5 112.39,23.33 v112.39,11.9
  Bottom 0.254: 98.42,10.63 97.15,10.63 94.61,8.09 RN1.5 | 98.42,10.63 99.69,11.9 IC2.14 | v112.39,11.9 107.31,11.9 106.04,10.63 98.42,10.63
N$5
  Top 0.254: IC9.5 22.22,33.49 23.49,32.22 23.49,22.06 22.22,20.79 IC6.5 22.22,16.98 13.33,16.98 13.33,25.87 6.98,32.22 6.98,58.89 5.71,58.89 U$1.11
N$6  (via drill 0.61)
  Top 0.254: v114.93,23.33 SV2.7
  Bottom 0.254: 100.96,15.71 95.88,15.71 95.88,10.63 94.61,10.63 92.07,8.09 RN1.6 | 100.96,15.71 102.23,14.44 IC2.15 | v114.93,23.33 107.31,15.71 100.96,15.71
N$7  (via drill 0.61)
  Top 0.254: v8.25,51.27 v8.25,60.16 | v27.3,60.16 IC7.3
  Bottom 0.254: v8.25,60.16 v27.3,60.16 | v8.25,51.27 6.98,50 5.71,50 U$1.15
N$8  (via drill 0.61)
  Top 0.254: v13.33,67.78 9.52,63.97 v9.52,50
  Bottom 0.254: v13.33,67.78 20.95,67.78 22.22,66.51 IC7.5 | v9.52,50 6.98,47.46 5.71,47.46 U$1.16
N$9  (via drill 0.61)
  Top 0.254: v14.6,61.43 10.79,57.62 v10.79,48.73
  Bottom 0.254: v14.6,61.43 17.14,63.97 IC7.7 | v10.79,48.73 6.98,44.92 5.71,44.92 U$1.17
N$10  (via drill 0.61)
  Top 0.254: v13.33,47.46 13.33,55.08 14.6,56.35 IC7.9
  Bottom 0.254: v13.33,47.46 8.25,42.38 5.71,42.38 U$1.18
N$11  (via drill 0.61)
  Top 0.254: v12.06,44.92 v12.06,53.81 | v19.68,53.81 IC7.11
  Bottom 0.254: v12.06,53.81 v19.68,53.81 | v12.06,44.92 6.98,39.84 5.71,39.84 U$1.19
N$12  (via drill 0.61)
  Top 0.254: v18.41,38.57 18.41,60.16 26.03,60.16 27.3,58.89 IC7.14
  Bottom 0.254: v18.41,38.57 17.14,37.3 5.71,37.3 U$1.20
N$13  (via drill 0.61)
  Top 0.254: v9.52,41.11 8.25,39.84 v8.25,36.03
  Bottom 0.254: v9.52,41.11 15.87,47.46 26.03,47.46 27.3,48.73 IC8.3 | v8.25,36.03 6.98,34.76 5.71,34.76 U$1.21
N$14  (via drill 0.61)
  Top 0.254: v20.95,30.95 20.95,47.46 22.22,48.73 IC8.5
  Bottom 0.254: v20.95,30.95 19.68,32.22 5.71,32.22 U$1.22
N$15  (via drill 0.61)
  Top 0.254: IC2.1 104.77,19.52 103.5,18.25 v103.5,4.28 107.31,4.28 114.93,11.9 114.93,20.79 SV2.9
  Bottom 0.254: v103.5,4.28 90.8,4.28 89.53,5.55 RN1.7
N$16  (via drill 0.61)
  Top 0.254: IC2.2 102.23,19.52 100.96,18.25 100.96,4.28 v99.69,3.01 116.2,3.01 122.55,9.36 SV2.11
  Bottom 0.254: v99.69,3.01 89.53,3.01 86.99,5.55 RN1.8
N$17  (via drill 0.61)
  Top 0.254: RN1.9 v84.45,22.06
  Bottom 0.254: v84.45,22.06 85.72,23.33 98.42,23.33 99.69,22.06 | SV2.13 123.82,24.6 102.23,24.6 99.69,22.06 | 99.69,22.06 IC2.3
N$18  (via drill 0.61)
  Top 0.254: v100.96,25.87 97.15,22.06 IC2.4
  Bottom 0.254: RN1.10 81.91,16.98 94.61,16.98 97.15,19.52 IC2.4 | SV2.15 126.36,27.14 107.31,27.14 106.04,25.87 v100.96,25.87
N$19  (via drill 0.61)
  Top 0.254: v127.63,57.62 127.63,41.11 125.09,38.57 IC10.8
  Bottom 0.254: v127.63,57.62 133.98,57.62 135.25,58.89 135.25,61.43 LED4.A
N$20  (via drill 0.61)
  Top 0.254: v26.03,89.37 v34.92,80.48 | v88.26,75.4 88.26,83.02 89.53,84.29 IC13.7 | IC14.6 v17.14,88.1 | v76.83,42.38 75.56,43.65 v75.56,61.43
  Bottom 0.254: v17.14,88.1 23.49,88.1 24.76,89.37 v26.03,89.37 | v34.92,80.48 37.46,77.94 78.1,77.94 | 78.1,77.94 83.18,77.94 85.72,75.4 v88.26,75.4 | v76.83,42.38 80.64,42.38 83.18,39.84 88.26,39.84 89.53,41.11 IC4.7 | v75.56,61.43 78.1,63.97 78.1,77.94
N$21  (via drill 0.61)
  Top 0.254: SV1.1 111.12,69.05 111.12,83.02 106.04,88.1 v99.69,88.1 | v83.18,89.37 79.37,85.56 79.37,60.16 78.1,58.89 78.1,53.81 v79.37,52.54 | v93.34,51.27 93.34,38.57 94.61,37.3 IC4.12
  Bottom 0.254: RN3.3 99.69,29.68 98.42,30.95 95.88,30.95 94.61,32.22 IC4.12 | v99.69,88.1 98.42,89.37 v83.18,89.37 | v79.37,52.54 80.64,51.27 v93.34,51.27
N$22  (via drill 0.61)
  Top 0.254: IC4.13 RN3.4 97.15,27.14 95.88,25.87 95.88,18.25 93.34,15.71 93.34,1.74 116.2,1.74 139.06,24.6 139.06,67.78 v137.79,69.05
  Bottom 0.254: SV1.3 113.66,69.05 v137.79,69.05
N$23  (via drill 0.61)
  Top 0.254: v95.88,32.22 95.88,30.95 94.61,29.68 RN3.5 | v114.93,63.97 SV1.5 | v107.31,63.97 104.77,66.51 100.96,66.51 100.96,39.84 103.5,37.3 103.5,32.22 102.23,30.95 100.96,30.95 99.69,32.22 IC4.14
  Bottom 0.254: v95.88,32.22 98.42,32.22 99.69,33.49 IC4.14 | v107.31,63.97 v114.93,63.97
N$24  (via drill 0.61)
  Top 0.254: v93.34,37.3 93.34,32.22 92.07,30.95 RN3.6 | SV1.7 118.74,69.05 121.28,69.05 121.28,58.89 122.55,57.62 122.55,55.08 121.28,55.08 v121.28,39.84
  Bottom 0.254: v93.34,37.3 100.96,37.3 | 100.96,37.3 102.23,36.03 IC4.15 | v121.28,39.84 117.47,36.03 107.31,36.03 106.04,37.3 100.96,37.3
N$25  (via drill 0.61)
  Top 0.254: v15.87,52.54 15.87,46.19 14.6,44.92 IC8.9
  Bottom 0.254: v15.87,52.54 5.71,52.54 U$1.14
N$26  (via drill 0.61)
  Top 0.254: v17.14,55.08 IC8.7
  Bottom 0.254: v17.14,55.08 5.71,55.08 U$1.13
N$27  (via drill 0.61)
  Top 0.254: v15.87,81.75 15.87,88.1 5.71,88.1 4.44,86.83 4.44,22.06 5.71,22.06 U$1.26
  Bottom 0.254: 23.49,81.75 22.22,80.48 IC14.4 | 23.49,81.75 28.57,81.75 29.84,80.48 IC14.1 | v15.87,81.75 23.49,81.75
N$28  (via drill 0.61)
  Top 0.254: v90.8,37.3 90.8,32.22 89.53,30.95 RN3.7 | v120.01,43.65 SV1.9
  Bottom 0.254: v90.8,37.3 92.07,38.57 102.23,38.57 104.77,41.11 IC4.1 118.74,42.38 v120.01,43.65
N$29  (via drill 0.61)
  Top 0.254: v88.26,37.3 88.26,32.22 86.99,30.95 RN3.8 | v103.5,65.24 103.5,44.92 102.23,43.65 IC4.2
  Bottom 0.254: v88.26,37.3 90.8,39.84 100.96,39.84 102.23,41.11 IC4.2 | SV1.11 120.01,65.24 v103.5,65.24
N$30  (via drill 0.61)
  Top 0.254: RN3.9 v84.45,43.65 | v132.71,38.57 v132.71,60.16 | v100.96,32.22 100.96,38.57 99.69,39.84 IC4.3
  Bottom 0.254: v84.45,43.65 85.72,44.92 98.42,44.92 99.69,43.65 IC4.3 | SV1.13 125.09,60.16 v132.71,60.16 | v132.71,38.57 128.9,34.76 108.58,34.76 106.04,32.22 v100.96,32.22
N$32
  Top 0.254: R4.2 136.52,61.43 135.25,62.7 131.44,62.7 LED4.K
N$33  (via drill 0.61)
  Top 0.254: v84.45,24.6 81.91,27.14 RN3.10 | v97.15,24.6 98.42,25.87 98.42,30.95 | 98.42,30.95 98.42,39.84 97.15,41.11 IC4.4 | v109.85,33.49 v109.85,51.27 | 98.42,30.95 v99.69,30.95
  Bottom 0.254: v84.45,24.6 v97.15,24.6 | SV1.15 132.71,62.7 135.25,62.7 137.79,60.16 137.79,53.81 136.52,53.81 131.44,48.73 127.63,48.73 126.36,50 112.39,50 111.12,51.27 v109.85,51.27 | v109.85,33.49 107.31,30.95 v99.69,30.95
N$34  (via drill 0.61)
  Top 0.254: IC10.2 IC10.1 114.93,53.81 113.66,55.08 113.66,84.29 103.5,94.45 78.1,94.45 78.1,90.64 60.32,90.64 v60.32,80.48 | v55.24,27.14 55.24,11.9 56.51,10.63 IC1.20 56.51,6.82 42.54,6.82 41.27,8.09 41.27,75.4 v45.08,79.21 | v94.61,25.87 IC2.5
  Bottom 0.254: v55.24,27.14 79.37,27.14 80.64,25.87 v94.61,25.87 | v60.32,80.48 59.05,79.21 v45.08,79.21
N$36  (via drill 0.61)
  Top 0.254: IC10.10 IC10.9 | v81.91,55.08 83.18,56.35 v83.18,63.97 | 93.34,66.51 94.61,65.24 IC15.5 | v92.07,67.78 93.34,66.51 | IC3.20 v56.51,56.35 | v95.88,91.91 93.34,91.91 93.34,66.51
  Bottom 0.254: v56.51,56.35 78.1,56.35 79.37,55.08 v81.91,55.08 | v83.18,63.97 86.99,67.78 v92.07,67.78 | v95.88,91.91 139.06,91.91 139.06,53.81 131.44,46.19 127.63,46.19 125.09,43.65 IC10.10
N$38
  Top 0.254: RN4.4 IC13.13 97.15,79.21 98.42,80.48 98.42,89.37 106.04,89.37 112.39,83.02 SV4.7
N$39  (via drill 0.61)
  Top 0.254: v98.42,72.86 99.69,74.13 IC13.14
  Bottom 0.254: v98.42,72.86 95.88,72.86 94.61,71.59 RN4.5 | SV4.6 113.66,74.13 102.23,74.13 99.69,76.67 IC13.14
N$40
  Bottom 0.254: RN4.6 92.07,69.05 93.34,67.78 106.04,67.78 108.58,70.32 108.58,71.59 116.2,71.59 SV4.5 114.93,75.4 103.5,75.4 102.23,76.67 IC13.15
N$41  (via drill 0.61)
  Top 0.254: v90.8,83.02 90.8,74.13 89.53,72.86 RN4.7
  Bottom 0.254: v90.8,83.02 103.5,83.02 104.77,84.29 IC13.1 120.01,85.56 SV4.4
N$42  (via drill 0.61)
  Top 0.254: v98.42,65.24 100.96,67.78 100.96,83.02 102.23,84.29 IC13.2 | v86.99,65.24 RN4.8
  Bottom 0.254: v86.99,65.24 v98.42,65.24 | SV4.3 122.55,88.1 103.5,88.1 102.23,86.83 IC13.2
N$43  (via drill 0.61)
  Top 0.254: RN4.9 v84.45,86.83
  Bottom 0.254: v84.45,86.83 85.72,88.1 98.42,88.1 99.69,86.83 | SV4.2 125.09,89.37 102.23,89.37 99.69,86.83 | 99.69,86.83 IC13.3
N$45
  Bottom 0.254: 100.96,72.86 99.69,71.59 RN4.3 | 100.96,72.86 SV4.8 | 100.96,72.86 99.69,74.13 97.15,74.13 94.61,76.67 IC13.12
N$46  (via drill 0.61)
  Top 0.254: v95.88,74.13 95.88,83.02 97.15,84.29 IC13.4 v97.15,90.64
  Bottom 0.254: v95.88,74.13 94.61,72.86 83.18,72.86 81.91,71.59 RN4.10 | SV4.1 127.63,90.64 v97.15,90.64
N$49  (via drill 0.61)
  Top 0.254: IC10.12 IC10.13 125.09,51.27 126.36,52.54 v126.36,93.18 | v55.24,83.02 55.24,76.67 56.51,75.4 IC5.20 | v94.61,90.64 IC13.5
  Bottom 0.254: v55.24,83.02 55.24,90.64 93.34,90.64 | 93.34,90.64 v94.61,90.64 | v126.36,93.18 95.88,93.18 93.34,90.64
N$50
  Top 0.254: IC9.15 29.84,25.87 28.57,24.6 28.57,16.98 26.03,14.44 12.06,14.44 12.06,11.9 9.52,9.36 3.17,9.36 3.17,86.83 5.71,89.37 19.68,89.37 IC14.5
N$51  (via drill 0.61)
  Top 0.254: v75.56,36.03 v75.56,42.38 | v94.61,46.19 IC4.5 | IC10.4 IC10.5
  Bottom 0.254: v75.56,36.03 60.32,36.03 56.51,32.22 IC11.20 | v75.56,42.38 76.83,43.65 83.18,43.65 85.72,46.19 v94.61,46.19 IC10.4
N$52  (via drill 0.61)
  Top 0.254: v26.03,88.1 26.03,81.75 24.76,80.48 IC14.3 | v41.27,89.37 42.54,90.64 55.24,90.64 55.24,84.29 56.51,83.02 v56.51,76.67 | v93.34,30.95 v93.34,18.25 | v81.91,44.92 v81.91,36.03
  Bottom 0.254: v26.03,88.1 27.3,89.37 v41.27,89.37 | v56.51,76.67 57.78,75.4 57.78,70.32 71.75,70.32 73.02,69.05 73.02,57.62 78.1,57.62 79.37,56.35 84.45,56.35 | 84.45,56.35 89.53,61.43 IC15.7 | v93.34,18.25 90.8,18.25 89.53,19.52 IC2.7 | v93.34,30.95 92.07,32.22 85.72,32.22 v81.91,36.03 | v81.91,44.92 78.1,48.73 78.1,53.81 81.91,53.81 84.45,56.35
N$55  (via drill 0.61)
  Top 0.254: v98.42,52.54 98.42,51.27 99.69,50 RN2.3 | SV3.8 107.31,33.49 v107.31,51.27
  Bottom 0.254: IC15.12 94.61,53.81 95.88,52.54 v98.42,52.54 106.04,52.54 v107.31,51.27
N$56
  Bottom 0.254: LED5.K R5.1
N$57  (via drill 0.61)
  Top 0.254: v130.17,47.46 130.17,72.86 LED5.A
  Bottom 0.254: v130.17,47.46 126.36,47.46 125.09,46.19 IC10.11
N$58  (via drill 0.61)
  Top 0.254: v121.28,29.68 121.28,38.57 120.01,39.84 v120.01,42.38
  Bottom 0.254: LED2.A 130.17,29.68 v121.28,29.68 | v120.01,42.38 121.28,43.65 121.28,48.73 IC10.3
N$59
  Bottom 0.254: R2.2 131.44,24.6 LED2.K
N$60  (via drill 0.61)
  Top 0.254: IC15.13 RN2.4 97.15,47.46 v99.69,44.92 | SV3.7 v112.39,43.65
  Bottom 0.254: v112.39,43.65 111.12,44.92 v99.69,44.92
N$61
  Bottom 0.254: LED3.K 132.71,44.92 135.25,44.92 137.79,42.38 R3.1
N$62
  Bottom 0.254: LED3.A 132.71,42.38 121.28,42.38 120.01,41.11 IC10.6
N$63  (via drill 0.61)
  Top 0.254: v99.69,51.27 IC15.14 | SV3.6 113.66,32.22 v113.66,47.46
  Bottom 0.254: RN2.5 94.61,50 95.88,51.27 v99.69,51.27 106.04,51.27 107.31,50 111.12,50 v113.66,47.46
N$64  (via drill 0.61)
  Top 0.254: v93.34,57.62 93.34,52.54 92.07,51.27 RN2.6 | v111.12,53.81 v111.12,33.49
  Bottom 0.254: v93.34,57.62 100.96,57.62 | 100.96,57.62 102.23,56.35 IC15.15 | SV3.5 114.93,33.49 v111.12,33.49 | v111.12,53.81 109.85,55.08 107.31,55.08 106.04,56.35 106.04,57.62 100.96,57.62
N$65  (via drill 0.61)
  Top 0.254: v90.8,57.62 90.8,52.54 89.53,51.27 RN2.7 | v104.77,58.89 IC15.1 | SV3.4 118.74,32.22 118.74,50 112.39,50 v112.39,60.16
  Bottom 0.254: v90.8,57.62 92.07,58.89 v104.77,58.89 | v112.39,60.16 109.85,62.7 IC15.1
N$66  (via drill 0.61)
  Top 0.254: v88.26,57.62 88.26,52.54 86.99,51.27 RN2.8 | SV3.3 123.82,29.68 123.82,24.6 135.25,24.6 135.25,57.62 v133.98,58.89
  Bottom 0.254: v88.26,57.62 90.8,60.16 100.96,60.16 | 100.96,60.16 102.23,61.43 IC15.2 | v133.98,58.89 112.39,58.89 109.85,61.43 107.31,61.43 106.04,60.16 100.96,60.16
N$67  (via drill 0.61)
  Top 0.254: RN2.9 v84.45,63.97 | SV3.2 126.36,29.68 126.36,27.14 131.44,27.14 131.44,41.11 130.17,42.38 130.17,46.19 131.44,47.46 v131.44,50 | v111.12,66.51 v111.12,55.08
  Bottom 0.254: v84.45,63.97 86.99,66.51 98.42,66.51 | 98.42,66.51 99.69,65.24 IC15.3 | v131.44,50 126.36,55.08 v111.12,55.08 | 98.42,66.51 v111.12,66.51
N$68  (via drill 0.61)
  Top 0.254: v94.61,52.54 95.88,52.54 95.88,60.16 | 95.88,60.16 97.15,61.43 IC15.4 | RN2.10 v81.91,52.54 | v136.52,39.84 137.79,41.11 137.79,67.78 135.25,70.32 v135.25,93.18 | v89.53,91.91 85.72,88.1 v85.72,74.13 | v94.61,74.13 95.88,72.86 95.88,60.16
  Bottom 0.254: v81.91,52.54 v94.61,52.54 | v136.52,39.84 SV3.1 | v135.25,93.18 133.98,94.45 92.07,94.45 v89.53,91.91 | v94.61,74.13 v85.72,74.13
RD  (via drill 0.61)
  Top 0.254: IC1.22 61.59,10.63 60.32,11.9 60.32,27.14 61.59,28.41 IC11.22 61.59,33.49 60.32,34.76 60.32,48.73 | v19.68,44.92 IC8.6 | 60.32,48.73 61.59,50 IC3.22 | 60.32,48.73 60.32,69.05 61.59,70.32 IC5.22
  Bottom 0.254: v19.68,44.92 26.03,44.92 26.03,39.84 73.02,39.84 76.83,36.03 76.83,33.49 62.86,33.49 61.59,32.22 IC11.22
VCC  (via drill 0.61)
  Top 0.254: RN1.1 IC2.16 106.04,13.17 | 106.04,13.17 C7.1 | 106.04,13.17 106.04,25.87 104.77,27.14 RN3.1 IC4.16 104.77,36.03 106.04,37.3 106.04,53.81 | C4.1 104.77,79.21 IC13.16 RN4.1 104.77,69.05 108.58,65.24 C5.1 104.77,56.35 IC15.16 | IC15.16 RN2.1 | C6.1 108.58,51.27 106.04,53.81 | IC15.16 106.04,53.81 | IC11.28 76.83,28.41 75.56,27.14 75.56,20.79 76.83,19.52 IC1.28 | 79.37,41.11 C10.1 80.64,52.54 79.37,53.81 79.37,58.89 C11.1 80.64,72.86 81.91,74.13 81.91,81.75 C12.1 80.64,84.29 84.45,88.1 84.45,93.18 103.5,93.18 v112.39,84.29 | 79.37,41.11 79.37,47.46 76.83,50 IC3.28 76.83,61.43 75.56,62.7 75.56,69.05 76.83,70.32 IC5.28 | C9.1 79.37,19.52 79.37,41.11 | IC6.6 19.68,20.79 18.41,22.06 18.41,29.68 19.68,30.95 IC9.6 | 33.65,13.17 37.46,13.17 37.46,15.71 | 33.65,13.17 32.38,13.17 IC6.16 | 37.46,15.71 C2.1 | 33.65,13.17 33.65,24.6 32.38,25.87 IC9.16 | 37.46,15.71 37.46,30.95 C1.1 37.46,33.49 37.46,46.19 C13.1 34.92,48.73 34.92,62.7 | 34.92,62.7 32.38,62.7 IC7.1 32.38,67.78 29.84,70.32 IC14.14 29.84,74.13 C15.1 | 34.92,62.7 C14.1 | C8.+ 13.33,85.56 v13.33,76.67
  Bottom 0.254: LED1.A 130.17,13.17 C7.1 | IC10.14 122.55,53.81 121.28,52.54 107.31,52.54 106.04,53.81 104.77,53.81 IC15.16 | C3.1 107.31,56.35 107.31,60.16 C5.1 | 76.83,16.98 76.83,18.25 C9.1 | 76.83,16.98 IC1.28 | C1.1 20.95,32.22 19.68,33.49 IC9.6 | C8.+ 6.98,86.83 5.71,85.56 U$1.1 | C13.1 34.92,48.73 32.38,48.73 IC8.1 | C15.1 v13.33,76.67 | C2.1 76.83,16.98 | C4.1 109.85,84.29 v112.39,84.29
WR  (via drill 0.61)
  Top 0.254: IC11.27 74.29,28.41 73.02,27.14 73.02,11.9 74.29,10.63 IC1.27 74.29,6.82 v71.75,6.82 | v18.41,30.95 18.41,37.3 17.14,38.57 IC8.10 | v10.79,11.9 v10.79,27.14
  Bottom 0.254: v18.41,30.95 14.6,30.95 v10.79,27.14 | v10.79,11.9 15.87,6.82 v71.75,6.82

### Text on the board
tNames: EPROM HI | HI 32K | EPROM LO | RAM HI | LO 32K | RAM LO | BANK 7 | BANK 6 | BANK 5 | BANK 4 | BANK 3 | BANK 2 | BANK 1 | BANK 0 | PWR